# Altium schematic sheet Main_Sheet.SchDoc: =Projectname
size A4; SheetNumber: 1; SheetTotal: 2
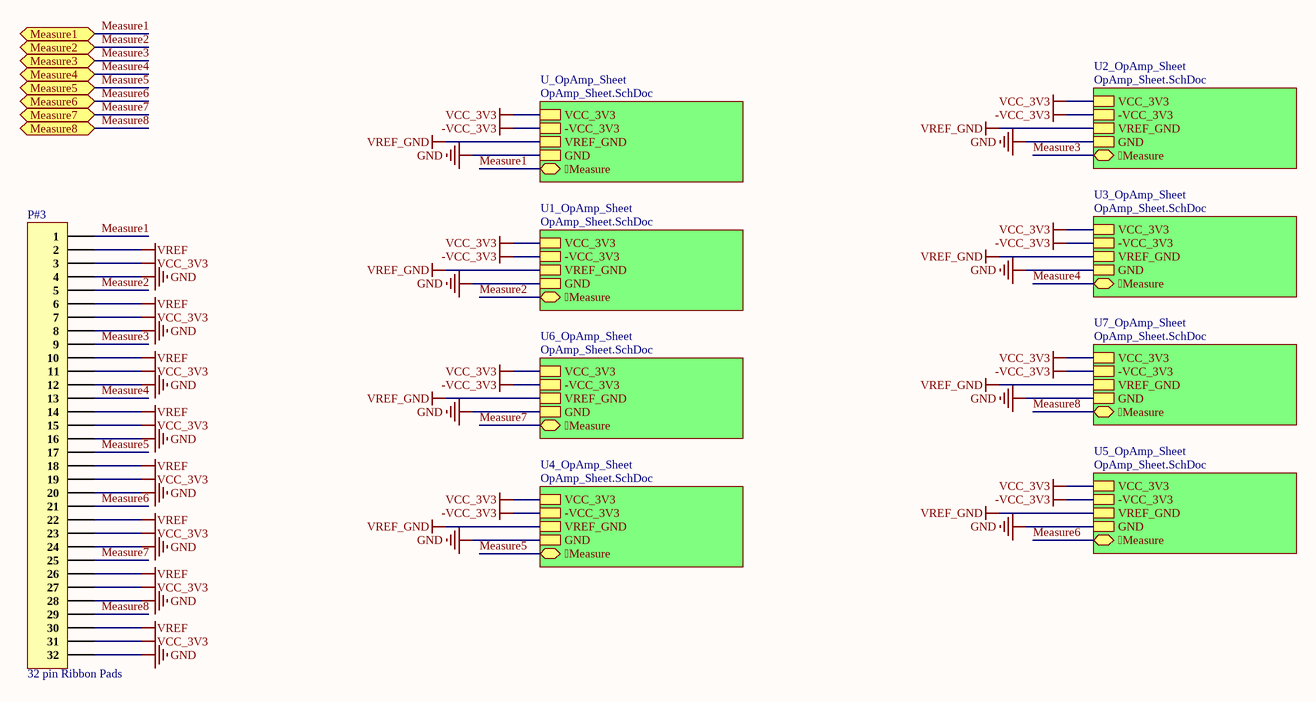
[diagram p0: Main_Sheet.SchDoc]

## Parts
P#3  32 pin Ribbon Pads  [32 pin Ribbon Pads.]

## Sub-sheets
U1_OpAmp_Sheet = OpAmp_Sheet.SchDoc: VCC_3V3, -VCC_3V3, VREF_GND, GND, Measure (bidir)
U2_OpAmp_Sheet = OpAmp_Sheet.SchDoc: VCC_3V3, -VCC_3V3, VREF_GND, GND, Measure (bidir)
U3_OpAmp_Sheet = OpAmp_Sheet.SchDoc: VCC_3V3, -VCC_3V3, VREF_GND, GND, Measure (bidir)
U4_OpAmp_Sheet = OpAmp_Sheet.SchDoc: VCC_3V3, -VCC_3V3, VREF_GND, GND, Measure (bidir)
U5_OpAmp_Sheet = OpAmp_Sheet.SchDoc: VCC_3V3, -VCC_3V3, VREF_GND, GND, Measure (bidir)
U6_OpAmp_Sheet = OpAmp_Sheet.SchDoc: VCC_3V3, -VCC_3V3, VREF_GND, GND, Measure (bidir)
U7_OpAmp_Sheet = OpAmp_Sheet.SchDoc: VCC_3V3, -VCC_3V3, VREF_GND, GND, Measure (bidir)
U_OpAmp_Sheet = OpAmp_Sheet.SchDoc: VCC_3V3, -VCC_3V3, VREF_GND, GND, Measure (bidir)

## Ports
Measure1 (bidir), Measure2 (bidir), Measure3 (bidir), Measure4 (bidir), Measure5 (bidir), Measure6 (bidir), Measure7 (bidir), Measure8 (bidir)

## Nets
-VCC_3V3: sheet U_OpAmp_Sheet/-VCC_3V3, sheet U1_OpAmp_Sheet/-VCC_3V3, sheet U2_OpAmp_Sheet/-VCC_3V3, sheet U3_OpAmp_Sheet/-VCC_3V3, sheet U4_OpAmp_Sheet/-VCC_3V3, sheet U5_OpAmp_Sheet/-VCC_3V3, sheet U6_OpAmp_Sheet/-VCC_3V3, sheet U7_OpAmp_Sheet/-VCC_3V3
GND: P#3.4 P#3.8 P#3.12 P#3.16 P#3.20 P#3.24 P#3.28 P#3.32 ; sheet U_OpAmp_Sheet/GND, sheet U1_OpAmp_Sheet/GND, sheet U2_OpAmp_Sheet/GND, sheet U3_OpAmp_Sheet/GND, sheet U4_OpAmp_Sheet/GND, sheet U5_OpAmp_Sheet/GND, sheet U6_OpAmp_Sheet/GND, sheet U7_OpAmp_Sheet/GND
VCC_3V3: P#3.3 P#3.7 P#3.11 P#3.15 P#3.19 P#3.23 P#3.27 P#3.31 ; sheet U_OpAmp_Sheet/VCC_3V3, sheet U1_OpAmp_Sheet/VCC_3V3, sheet U2_OpAmp_Sheet/VCC_3V3, sheet U3_OpAmp_Sheet/VCC_3V3, sheet U4_OpAmp_Sheet/VCC_3V3, sheet U5_OpAmp_Sheet/VCC_3V3, sheet U6_OpAmp_Sheet/VCC_3V3, sheet U7_OpAmp_Sheet/VCC_3V3
VREF: P#3.2 P#3.6 P#3.10 P#3.14 P#3.18 P#3.22 P#3.26 P#3.30
VREF_GND: sheet U_OpAmp_Sheet/VREF_GND, sheet U1_OpAmp_Sheet/VREF_GND, sheet U2_OpAmp_Sheet/VREF_GND, sheet U3_OpAmp_Sheet/VREF_GND, sheet U4_OpAmp_Sheet/VREF_GND, sheet U5_OpAmp_Sheet/VREF_GND, sheet U6_OpAmp_Sheet/VREF_GND, sheet U7_OpAmp_Sheet/VREF_GND
Measure1: P#3.1 ; port Measure1, sheet U_OpAmp_Sheet/Measure
Measure2: P#3.5 ; port Measure2, sheet U1_OpAmp_Sheet/Measure
Measure3: P#3.9 ; port Measure3, sheet U2_OpAmp_Sheet/Measure
Measure4: P#3.13 ; port Measure4, sheet U3_OpAmp_Sheet/Measure
Measure5: P#3.17 ; port Measure5, sheet U4_OpAmp_Sheet/Measure
Measure6: P#3.21 ; port Measure6, sheet U5_OpAmp_Sheet/Measure
Measure7: P#3.25 ; port Measure7, sheet U6_OpAmp_Sheet/Measure
Measure8: P#3.29 ; port Measure8, sheet U7_OpAmp_Sheet/Measure

## Notes on the sheet
- File:
- Title:
- Date:
- Page
- Num:
- Total:
- Drawn By: Huzaifa Ali

## Library data of the parts
P#3 = 32 pin Ribbon Pads: Ribbon wire Connection Pads